# Altium project ORing Board V1.PrjPcb
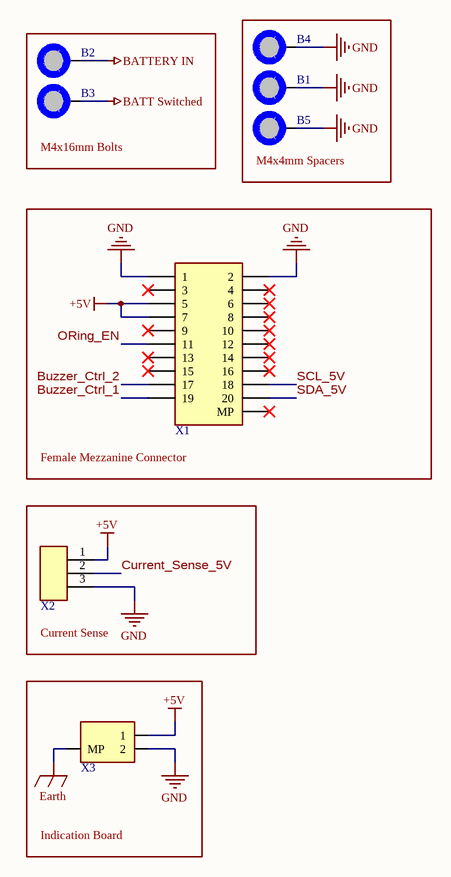
[diagram p0: Connectors.SchDoc]
5 sheets, 70 parts. Net scope: global (net labels, ports and power ports of the same name join across sheets).
Board file: Layout.PcbDoc
Sheets:
  Connectors.SchDoc
  ORing Controller.SchDoc
  Power.SchDoc
  Buzzers.SchDoc
  Current Sensor ADC.SchDoc

## Sheet Connectors.SchDoc
size A; SheetNumber: 1; SheetTotal: 5

### Parts
B1  M4 4mm Spacer  [[Bolt] M4 len=4mm OD=6mm Spacer]  (value not drawn)
B2  M4 16mm  [[Bolt] M4 16mm Button Head Hex Bolt]  (value not drawn)
B3  M4 16mm  [[Bolt] M4 16mm Button Head Hex Bolt]  (value not drawn)
B4  M4 4mm Spacer  [[Bolt] M4 len=4mm OD=6mm Spacer]  (value not drawn)
B5  M4 4mm Spacer  [[Bolt] M4 len=4mm OD=6mm Spacer]  (value not drawn)
X1  [Mezzanine] 20pin 0.4mm Female  [[Mezzanine] 20pin 0.4mm Female]  (value not drawn)
X2  [Sherlock] 3pin 90deg  [[Sherlock] 3pin 90deg]  (value not drawn)
X3  [Pheonix] 2pin 2.5mm pitch  [[Pheonix] 2pin 2.5mm pitch]  (value not drawn)

### Blocks framed on the sheet
M4x16mm Bolts: B2 B3
M4x4mm Spacers: B1 B4 B5
Female Mezzanine Connector: X1
Current Sense: X2
Indication Board: X3

### Nets
+5V: X1.5 X1.7 X2.1 X3.1
BATT Switched: B3.1
BATTERY IN: B2.1
Earth: X3.MP
GND: B1.1 B4.1 B5.1 X1.1 X1.2 X2.3 X3.2
Buzzer_Ctrl_1: X1.19
Buzzer_Ctrl_2: X1.17
Current_Sense_5V: X2.2
ORing_EN: X1.11
SCL_5V: X1.18
SDA_5V: X1.20

Not connected (* = marked no-connect by the designer): X1 3* 4* 6* 8* 9* 10* 12* 13* 14* 15* 16* MP*

### Library data of the parts
B1 B4 B5 = [Bolt] M4 len=4mm OD=6mm Spacer: ID: 4mm / OD: 6mm; System: Connector; ComponentLink1Description: McMaster Supplier; ComponentLink1URL: https://www.mcmaster.com/94669A006/
B2 B3 = [Bolt] M4 16mm Button Head Hex Bolt: 92095A194; System: Connector; ComponentLink1Description: McMaster Link; ComponentLink1URL: https://www.mcmaster.com/92095A194/
X1 = [Mezzanine] 20pin 0.4mm Female: DF40C-20DP-0.4V(51); System: Connector; Supplier 1: DigiKey; Supplier Part Number 1: H11618CT-ND
X2 = [Sherlock] 3pin 90deg: 0353630360; Supplier 1: DigiKey; Supplier Part Number 1: WM18932-ND
X3 = [Pheonix] 2pin 2.5mm pitch: 1778764; System: Connector; Supplier 1: DigiKey; Supplier Part Number 1: 277-2315-1-ND

## Sheet ORing Controller.SchDoc
size B; SheetNumber: 2; SheetTotal: 5
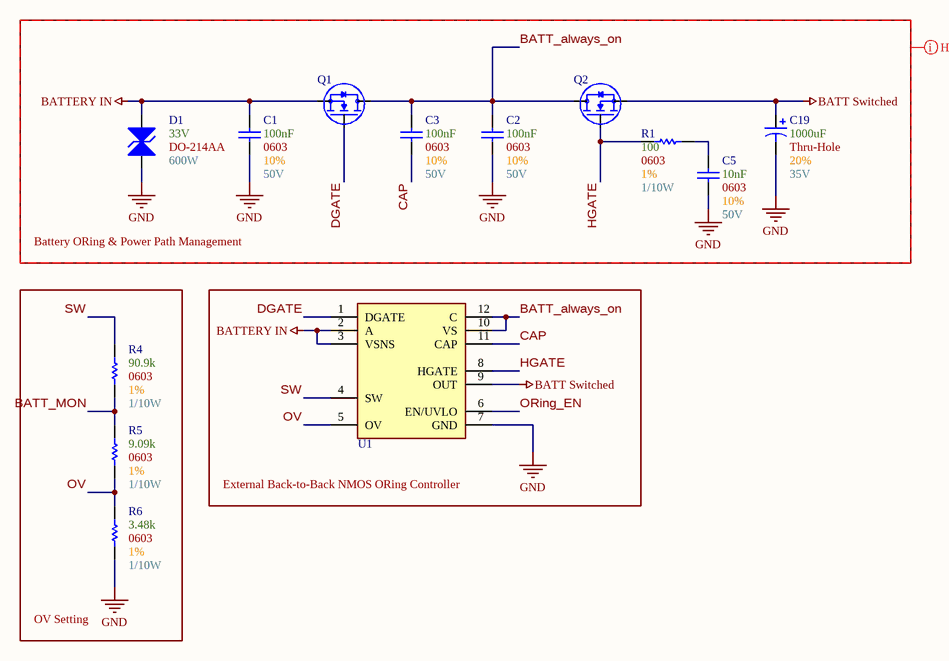
[diagram p1: ORing Controller.SchDoc]

### Parts
C1  Max Voltage: 50V  Size Package: 0603  Tolerance: 10%  Capacitance: 100nF  [[Cap] SMD 0603]  (hidden comment: [Cap] 0603 0.1uF 10% 50V)
C2  Max Voltage: 50V  Size Package: 0603  Tolerance: 10%  Capacitance: 100nF  [[Cap] SMD 0603]  (hidden comment: [Cap] 0603 0.1uF 10% 50V)
C3  Max Voltage: 50V  Size Package: 0603  Tolerance: 10%  Capacitance: 100nF  [[Cap] SMD 0603]  (hidden comment: [Cap] 0603 0.1uF 10% 50V)
C5  Max Voltage: 50V  Size Package: 0603  Tolerance: 10%  Capacitance: 10nF  [[Cap] SMD 0603]  (hidden comment: [Cap] 0603 0.01uF 10% 50V)
C19  Max Voltage: 35V  Size Package: Thru-Hole  Tolerance: 20%  Capacitance: 1000uF  [[Cap] Thru-Hole Right-Angle Polarized 10mm]  (hidden comment: [Cap] Thru-Hole 1000uF 20% 35V)
D1  Wattage: 600W  Optimal Zener Voltage: 33V  [[Diode] SMD DO-214AA]  (hidden comment: DO-214AA)
Q1  [NMOS] SMD 40V 175A 0.55mOhm  [[NMOS] SMD 40V 175A 0.55mOhm]  (value not drawn)
Q2  [NMOS] SMD 40V 175A 0.55mOhm  [[NMOS] SMD 40V 175A 0.55mOhm]  (value not drawn)
R1  Wattage: 1/10W  Tolerance: 1%  Resistance: 100  Size Package: 0603  [[Res] SMD 0603]  (hidden comment: [100] SMD 0603 1% 1/10W)
R4  Wattage: 1/10W  Tolerance: 1%  Resistance: 90.9k  Size Package: 0603  [[Res] SMD 0603]  (hidden comment: [90.9k] SMD 0603 1% 1/10W)
R5  Wattage: 1/10W  Tolerance: 1%  Resistance: 9.09k  Size Package: 0603  [[Res] SMD 0603]  (hidden comment: [9.09k] SMD 0603 1% 1/10W)
R6  Wattage: 1/10W  Tolerance: 1%  Resistance: 3.48k  Size Package: 0603  [[Res] SMD 0603]  (hidden comment: [3.48k] SMD 0603 1% 1/10W_1)
U1  [ORing] Back-to-Back External NMOS Controller  [[ORing] Back-to-Back External NMOS Controller]  (value not drawn)

### Blocks framed on the sheet
Battery ORing & Power Path Management: C1-C3 C5 C19 D1 Q1 Q2 R1
OV Setting: R4-R6
External Back-to-Back NMOS ORing Controller: U1

### Nets
BATT Switched: C19.1 Q2.1(Source) U1.9(OUT)
BATTERY IN: C1.2 D1.2(K) Q1.1(Source) U1.2(A) U1.3(VSNS)
GND: C1.1 C2.1 C5.1 C19.2 D1.1(A) R6.2 U1.7(GND)
BATT_always_on: C2.2 C3.2 Q1.3(Drain) Q2.3(Drain) U1.10(VS) U1.12(C)
BATT_MON: R4.1 R5.2
CAP: C3.1 U1.11(CAP)
DGATE: Q1.2(Gate) U1.1(DGATE)
HGATE: Q2.2(Gate) R1.1 U1.8(HGATE)
ORing_EN: U1.6(EN/UVLO)
OV: R5.1 R6.1 U1.5(OV)
SW: R4.2 U1.4(SW)
NetC5_2: C5.2 R1.2

### Layout directives
net class High_Current_Nets: BATT Switched, BATT_always_on, BATTERY IN, CAP, DGATE, GND, HGATE

### Library data of the parts
C1-C3 = [Cap] 0603 0.1uF 10% 50V: CL10B104KB8NNNC; Supplier 1: DigiKey; Supplier Part Number 1: 1276-1000-6-ND
C5 = [Cap] 0603 0.01uF 10% 50V: C0603C103K5RACTU; Supplier 1: DigiKey; Supplier Part Number 1: 399-C0603C103K5RACTUDKR-ND
C19 = [Cap] Thru-Hole 1000uF 20% 35V: 35PK1000MEFC10X20; Supplier 1: DigiKey; Supplier Part Number 1: 1189-1742-ND
D1 = [TVS] SMBJ33CA: SMBJ33CA; Supplier 1: DigiKey; Supplier Part Number 1: SMBJ33CA-FDICT-ND; Footprint: DO-214AA
Q1 Q2 = [NMOS] SMD 40V 175A 0.55mOhm: IAUCN04S7N005ATMA1; Supplier 1: DigiKey; Supplier Part Number 1: 448-IAUCN04S7N005ATMA1CT-ND
R1 = [100] SMD 0603 1% 1/10W: RC0603FR-07100RL; Supplier 1: DigiKey; Supplier Part Number 1: 311-100HRDKR-ND
R4 = [90.9k] SMD 0603 1% 1/10W: CR0603-FX-9092ELF; Supplier 1: DigiKey; Supplier Part Number 1: CR0603-FX-9092ELFCT-ND
R5 = [9.09k] SMD 0603 1% 1/10W: RMCF0603FT9K09; Supplier 1: DigiKey; Supplier Part Number 1: RMCF0603FT9K09CT-ND
R6 = [3.48k] SMD 0603 1% 1/10W_1: RMCF0603FT3K48; Supplier 1: DigiKey; Supplier Part Number 1: RMCF0603FT3K48CT-ND
U1 = [ORing] Back-to-Back External NMOS Controller: LM74810QDRRRQ1; Supplier 1: DigiKey; Supplier Part Number 1: 296-LM74810QDRRRQ1CT-ND

## Sheet Power.SchDoc
size B; SheetNumber: 3; SheetTotal: 5
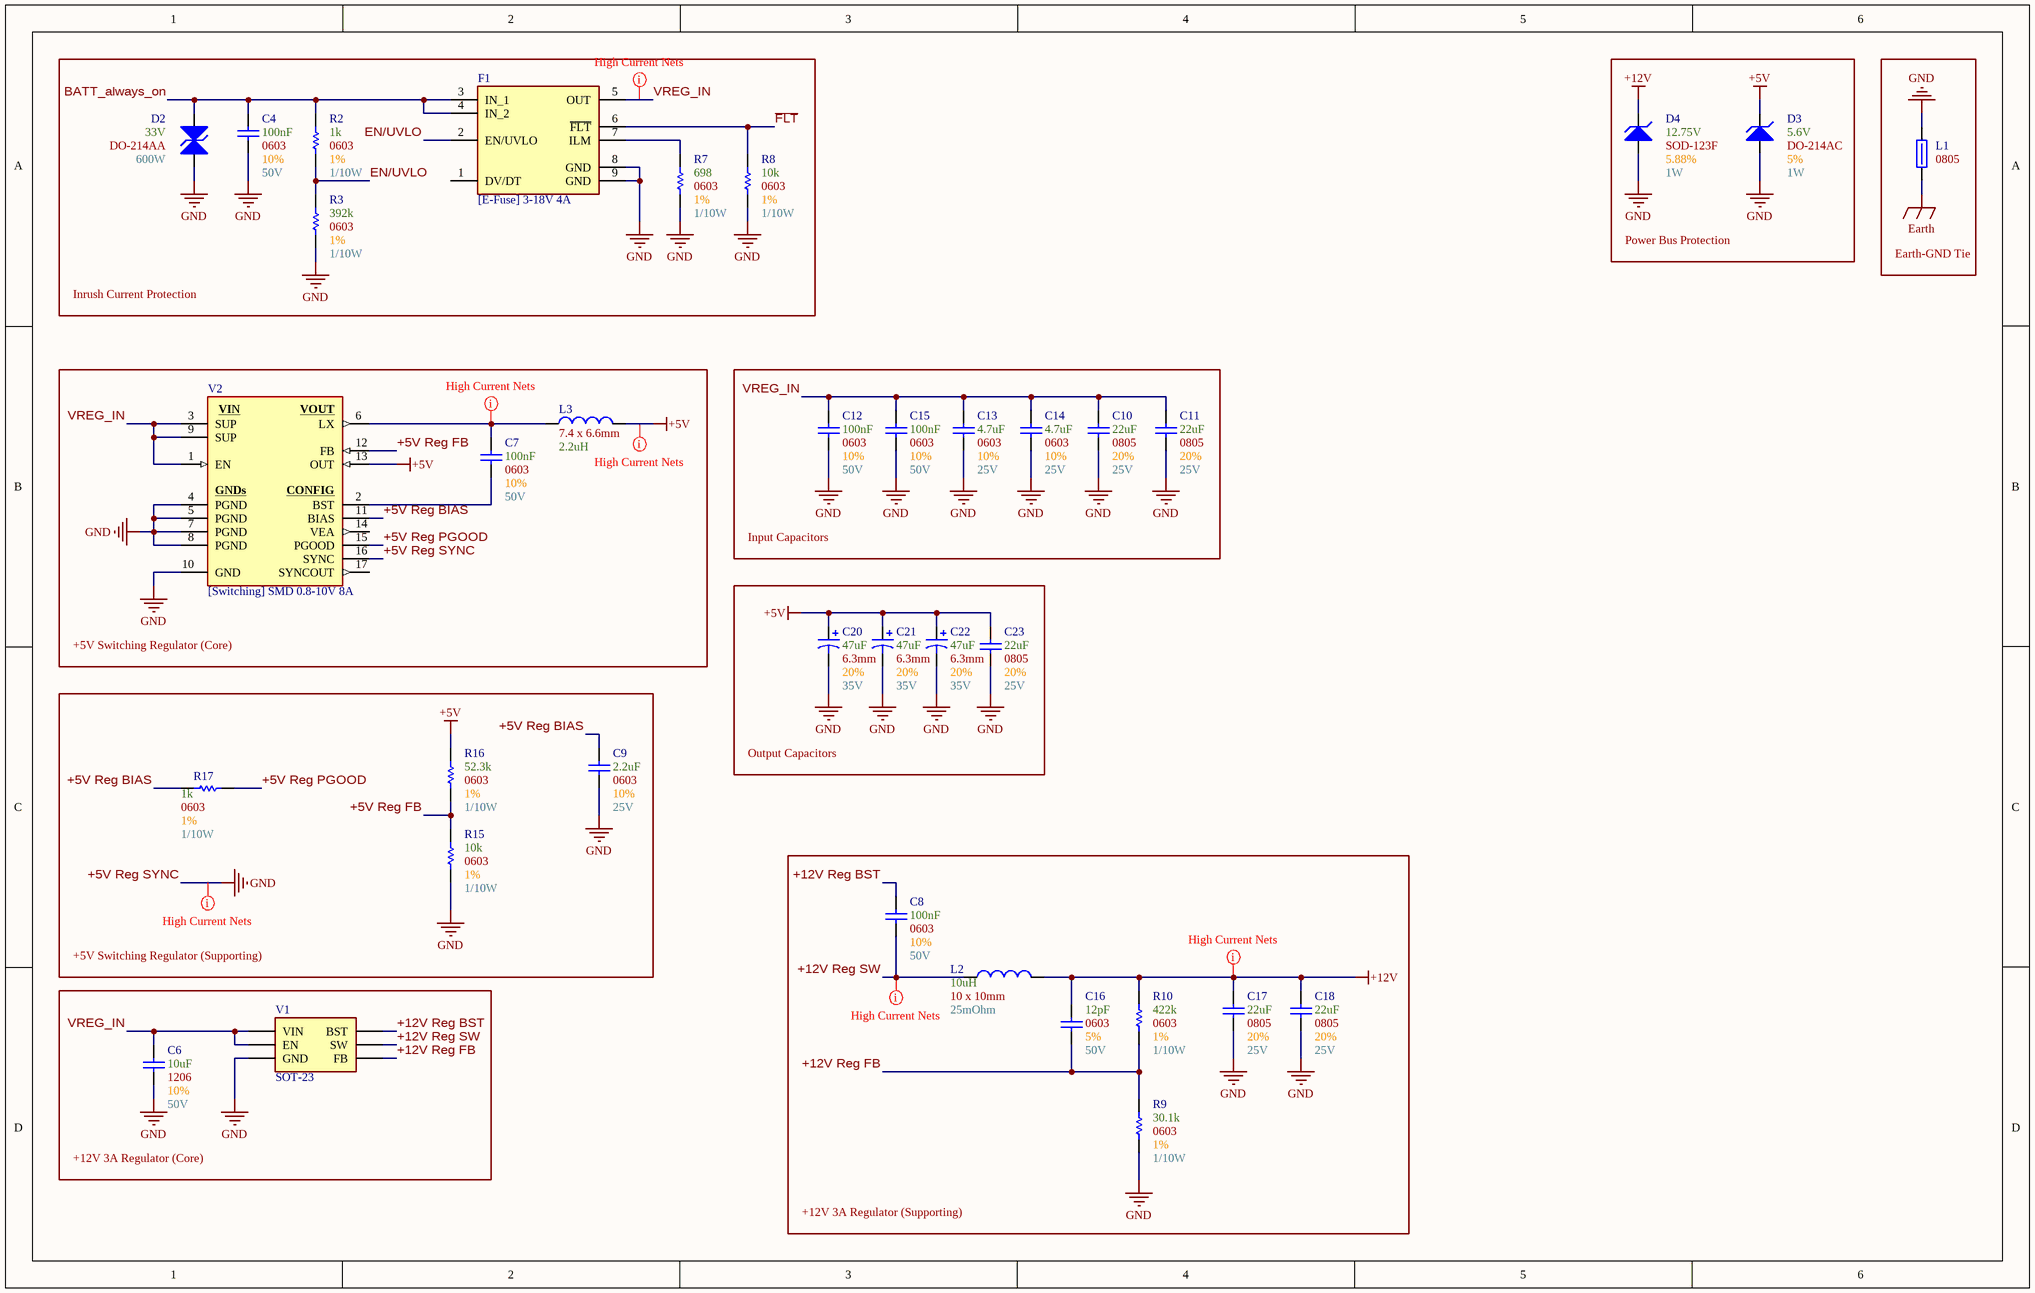
[diagram p2: Power.SchDoc]

### Parts
C4  Max Voltage: 50V  Size Package: 0603  Tolerance: 10%  Capacitance: 100nF  [[Cap] SMD 0603]  (hidden comment: [Cap] 0603 0.1uF 10% 50V)
C6  Max Voltage: 50V  Size Package: 1206  Tolerance: 10%  Capacitance: 10uF  [[Cap] SMD 1206]  (hidden comment: [Cap] 1206 10uF 20% 50V)
C7  Max Voltage: 50V  Size Package: 0603  Tolerance: 10%  Capacitance: 100nF  [[Cap] SMD 0603]  (hidden comment: [Cap] 0603 0.1uF 10% 50V)
C8  Max Voltage: 50V  Size Package: 0603  Tolerance: 10%  Capacitance: 100nF  [[Cap] SMD 0603]  (hidden comment: [Cap] 0603 0.1uF 10% 50V)
C9  Max Voltage: 25V  Size Package: 0603  Tolerance: 10%  Capacitance: 2.2uF  [[Cap] SMD 0603]  (hidden comment: [Cap] 0603 2.2uF 10% 25V)
C10  Max Voltage: 25V  Size Package: 0805  Tolerance: 20%  Capacitance: 22uF  [[Cap] SMD 0805]  (hidden comment: [Cap] 0805 22uF 20% 25V)
C11  Max Voltage: 25V  Size Package: 0805  Tolerance: 20%  Capacitance: 22uF  [[Cap] SMD 0805]  (hidden comment: [Cap] 0805 22uF 20% 25V)
C12  Max Voltage: 50V  Size Package: 0603  Tolerance: 10%  Capacitance: 100nF  [[Cap] SMD 0603]  (hidden comment: [Cap] 0603 0.1uF 10% 50V)
C13  Max Voltage: 25V  Size Package: 0603  Tolerance: 10%  Capacitance: 4.7uF  [[Cap] SMD 0603]  (hidden comment: [Cap] 0603 4.7uF 10% 25V)
C14  Max Voltage: 25V  Size Package: 0603  Tolerance: 10%  Capacitance: 4.7uF  [[Cap] SMD 0603]  (hidden comment: [Cap] 0603 4.7uF 10% 25V)
C15  Max Voltage: 50V  Size Package: 0603  Tolerance: 10%  Capacitance: 100nF  [[Cap] SMD 0603]  (hidden comment: [Cap] 0603 0.1uF 10% 50V)
C16  Max Voltage: 50V  Size Package: 0603  Tolerance: 5%  Capacitance: 12pF  [[Cap] SMD 0603]  (hidden comment: [Cap] 0603 12pF 5% 50V)
C17  Max Voltage: 25V  Size Package: 0805  Tolerance: 20%  Capacitance: 22uF  [[Cap] SMD 0805]  (hidden comment: [Cap] 0805 22uF 20% 25V)
C18  Max Voltage: 25V  Size Package: 0805  Tolerance: 20%  Capacitance: 22uF  [[Cap] SMD 0805]  (hidden comment: [Cap] 0805 22uF 20% 25V)
C20  Max Voltage: 35V  Size Package: 6.3mm  Tolerance: 20%  Capacitance: 47uF  [[Cap] SMD Polarized, 6.3mm]  (hidden comment: [Cap] 6.3mm 47uF 20% 35V)
C21  Max Voltage: 35V  Size Package: 6.3mm  Tolerance: 20%  Capacitance: 47uF  [[Cap] SMD Polarized, 6.3mm]  (hidden comment: [Cap] 6.3mm 47uF 20% 35V)
C22  Max Voltage: 35V  Size Package: 6.3mm  Tolerance: 20%  Capacitance: 47uF  [[Cap] SMD Polarized, 6.3mm]  (hidden comment: [Cap] 6.3mm 47uF 20% 35V)
C23  Max Voltage: 25V  Size Package: 0805  Tolerance: 20%  Capacitance: 22uF  [[Cap] SMD 0805]  (hidden comment: [Cap] 0805 22uF 20% 25V)
D2  Wattage: 600W  Optimal Zener Voltage: 33V  [[Diode] SMD DO-214AA]  (hidden comment: DO-214AA)
D3  Tolerance: 5%  Wattage: 1W  Optimal Zener Voltage: 5.6V  [[Diode] SMD DO-214AC]  (hidden comment: DO-214AC)
D4  Tolerance: 5.88%  Wattage: 1W  Optimal Zener Voltage: 12.75V  [[Diode] SOD-123F]  (hidden comment: SOD-123F)
F1  [E-Fuse] 3-18V 4A  [[E-Fuse] 3-18V 4A]
L1  Size Package: 0805  [[Ferrite] SMD 0805]  (hidden comment: 652-MH2029-300Y)
L2  DC Resistance: 25mOhm  Package: 10 x 10mm  Inductance: 10uH  [[10uH] SMD Nonstandard 3.8A]  (hidden comment: [10uH] SMD Nonstandard 3.8A)
L3  Package: 7.4 x 6.6mm  Inductance: 2.2uH  [[Inductor] SMD 7.4 X 6.6 X 3 MM]  (hidden comment: [2.2uH] SMD Nonstandard 10A)
R2  Wattage: 1/10W  Tolerance: 1%  Resistance: 1k  Size Package: 0603  [[Res] SMD 0603]  (hidden comment: [1k] SMD 0603 1% 1/10W)
R3  Wattage: 1/10W  Tolerance: 1%  Resistance: 392k  Size Package: 0603  [[Res] SMD 0603]  (hidden comment: [392k] SMD 0603 1% 1/10W)
R7  Wattage: 1/10W  Tolerance: 1%  Resistance: 698  Size Package: 0603  [[Res] SMD 0603]  (hidden comment: [698] SMD 0603 1% 1/10W_1)
R8  Wattage: 1/10W  Tolerance: 1%  Resistance: 10k  Size Package: 0603  [[Res] SMD 0603]  (hidden comment: [10k] SMD 0603 1% 1/8W)
R9  Wattage: 1/10W  Tolerance: 1%  Resistance: 30.1k  Size Package: 0603  [[Res] SMD 0603]  (hidden comment: [30.1k] SMD 0603 1% 1/10W)
R10  Wattage: 1/10W  Tolerance: 1%  Resistance: 422k  Size Package: 0603  [[Res] SMD 0603]  (hidden comment: [422k] SMD 0603 1% 1/10W)
R15  Wattage: 1/10W  Tolerance: 1%  Resistance: 10k  Size Package: 0603  [[Res] SMD 0603]  (hidden comment: [10k] SMD 0603 1% 1/8W)
R16  Wattage: 1/10W  Tolerance: 1%  Resistance: 52.3k  Size Package: 0603  [[Res] SMD 0603]  (hidden comment: [52.3k] SMD 0603 1% 1/10W)
R17  Wattage: 1/10W  Tolerance: 1%  Resistance: 1k  Size Package: 0603  [[Res] SMD 0603]  (hidden comment: [1k] SMD 0603 1% 1/10W)
V1  SOT-23  [SOT-23]
V2  [Switching] SMD 0.8-10V 8A  [[Switching] 17-PowerWFQFN]

### Blocks framed on the sheet
Inrush Current Protection: C4 D2 F1 R2 R3 R7 R8
Power Bus Protection: D3 D4
Earth-GND Tie: L1
+5V Switching Regulator (Core): C7 L3 V2
Input Capacitors: C10-C15
Output Capacitors: C20-C23
+5V Switching Regulator (Supporting): C9 R15-R17
+12V 3A Regulator (Supporting): C8 C16-C18 L2 R9 R10
+12V 3A Regulator (Core): C6 V1

### Nets
+5V: C20.1 C21.1 C22.1 C23.2 D3.1(K) L3.2 R16.2 V2.13(OUT)
+12V: C16.2 C17.2 C18.2 D4.1(K) L2.2 R10.2
Earth: L1.1
GND: C4.1 C6.1 C9.1 C10.1 C11.1 C12.1 C13.1 C14.1 C15.1 C17.1 C18.1 C20.2 C21.2 C22.2 C23.1 D2.1(A) D3.2(A) D4.2(A) F1.8(GND) F1.9(GND) L1.2 R3.1 R7.1 R8.1 R9.1 R15.1 V1.4(GND) V2.4(PGND) V2.5(PGND) V2.7(PGND) V2.8(PGND) V2.10(GND) V2.16(SYNC)  [also labelled +5V Reg SYNC]
+5V Reg BIAS: C9.2 R17.1 V2.11(BIAS)
+5V Reg FB: R15.2 R16.1 V2.12(FB)
+5V Reg PGOOD: R17.2 V2.15(PGOOD)
+12V Reg BST: C8.2 V1.6(BST)
+12V Reg FB: C16.1 R9.2 R10.1 V1.1(FB)
+12V Reg SW: C8.1 L2.1 V1.5(SW)
~{FLT}: F1.6(~{FLT}) R8.2
BATT_always_on: C4.2 D2.2(K) F1.3(IN_1) F1.4(IN_2) R2.2
EN/UVLO: F1.2(EN/UVLO) R2.1 R3.2
VREG_IN: C6.2 C10.2 C11.2 C12.2 C13.2 C14.2 C15.2 F1.5(OUT) V1.2(EN) V1.3(VIN) V2.1(EN) V2.3(SUP) V2.9(SUP)
NetC7_1: C7.1 V2.2(BST)
NetC7_2: C7.2 L3.1 V2.6(LX)
NetF1_7: F1.7(ILM) R7.2

Not connected (* = marked no-connect by the designer): F1 1(DV/DT); V2 14(VEA) 17(SYNCOUT)

### Layout directives
net class High_Current_Nets: +5V, +12V, +12V Reg SW, GND, NetC7_2, VREG_IN

### Notes on the sheet
- (in symbol [Switching] SMD 0.8-10V 8A) VIN; VOUT; GNDs; CONFIG

### Library data of the parts
C4 C7 C8 C12 C15 = [Cap] 0603 0.1uF 10% 50V: CL10B104KB8NNNC; Supplier 1: DigiKey; Supplier Part Number 1: 1276-1000-6-ND
C6 = [Cap] 1206 10uF 20% 50V: CGA5L3X5R1H106M160AB; Supplier 1: DigiKey; Supplier Part Number 1: 445-12883-6-ND
C9 = [Cap] 0603 2.2uF 10% 25V: GRM188R61E225KA12D; Supplier 1: DigiKey; Supplier Part Number 1: 490-10731-1-ND
C10 C11 C17 C18 C23 = [Cap] 0805 22uF 20% 25V: CL21A226MAYNNWE; Supplier 1: DigiKey; Supplier Part Number 1: 1276-CL21A226MAYNNWECT-ND
C13 C14 = [Cap] 0603 4.7uF 10% 25V: GRM188R61E475KE11D; Supplier 1: DigiKey; Supplier Part Number 1: 490-7203-6-ND
C16 = [Cap] 0603 12pF 5% 50V: C0603C120J5GACTU; Supplier 1: DigiKey; Supplier Part Number 1: 399-C0603C120J5GACTUCT-ND
C20-C22 = [Cap] 6.3mm 47uF 20% 35V: UWT1V470MCL1GS; Supplier 1: DigiKey; Supplier Part Number 1: 493-2202-1-ND
D2 = [TVS] SMBJ33CA: SMBJ33CA; Supplier 1: DigiKey; Supplier Part Number 1: SMBJ33CA-FDICT-ND; Footprint: DO-214AA
D3 = [Zener] SMD 5.6V 1W 5%: SMAZ5V6-13-F; Supplier 1: DigiKey; Supplier Part Number 1: SMAZ5V6-FDICT-ND; Footprint: DO-214AC
D4 = [Zener] SMD 12.75V 1W 5.88%: KDZVTR12B; Supplier 1: DigiKey; Supplier Part Number 1: KDZVTR12BCT-ND; Footprint: SOD-123F
F1 = [E-Fuse] 3-18V 4A: TPS259571DSGR; Supplier 1: DigiKey; Supplier Part Number 1: 296-50500-1-ND
L1 = [Ferrite] SMD 0805 3A 30ohm: Res @ Freq: 30 @ 100MHz; Supplier 1: DigiKey; Supplier Part Number 1: MH2029-300YCT-ND
L2 = [10uH] SMD Nonstandard 3.8A: SRU1038-100Y; Supplier 1: DigiKey; Supplier Part Number 1: SRU1038-100YCT-ND
L3 = [2.2uH] SMD Nonstandard 10A: ECS-MPIL0630-2R2MC; Supplier 1: DigiKey; Supplier Part Number 1: XC2402CT-ND
R2 R17 = [1k] SMD 0603 1% 1/10W: RMCF0603FT1K00; Supplier 1: DigiKey; Supplier Part Number 1: RMCF0603FT1K00DKR-ND
R3 = [392k] SMD 0603 1% 1/10W: CR0603-FX-3923ELF; Supplier 1: DigiKey; Supplier Part Number 1: 118-CR0603-FX-3923ELFCT-ND
R7 = [698] SMD 0603 1% 1/10W_1: RMCF0603FT698R; Supplier 1: DigiKey; Supplier Part Number 1: RMCF0603FT698RCT-ND
R8 R15 = [10k] SMD 0603 1% 1/8W: RMCF0603FT10K0; Supplier 1: DigiKey; Supplier Part Number 1: RMCF0603FT10K0DKR-ND
R9 = [30.1k] SMD 0603 1% 1/10W: RC0603FR-0730K1L; Supplier 1: DigiKey; Supplier Part Number 1: 311-30.1KHRCT-ND
R10 = [422k] SMD 0603 1% 1/10W: ERJ-3EKF4223V; Supplier 1: DigiKey; Supplier Part Number 1: P422KHDKR-ND
R16 = [52.3k] SMD 0603 1% 1/10W: RC0603FR-0752K3L; Supplier 1: DigiKey; Supplier Part Number 1: 311-52.3KHRCT-ND
V1 = [Switching] SMD 0.8-31V 3A: AP63301WU-7; Supplier 1: DigiKey; Supplier Part Number 1: 31-AP63301WU-7CT-ND
V2 = [Switching] SMD 0.8-10V 8A: MAX20408AFOF/VY+; Supplier 1: DigiKey; Supplier Part Number 1: 505-MAX20408AFOF/VY+-ND

## Sheet Buzzers.SchDoc
size A; SheetNumber: 4; SheetTotal: 5
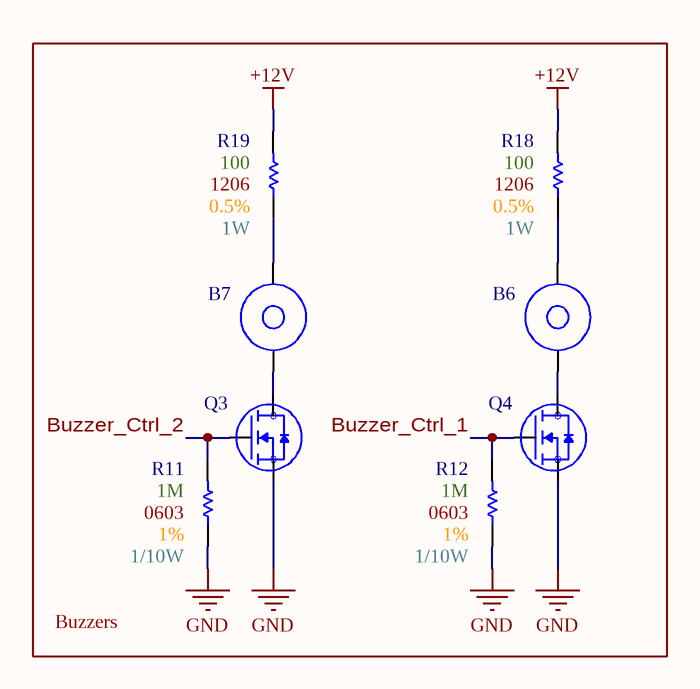
[diagram p3: Buzzers.SchDoc]

### Parts
B6  Passive buzzer  [[Buzzer] Passive SMD 12V 80mA]  (value not drawn)
B7  Passive buzzer  [[Buzzer] Passive SMD 12V 80mA]  (value not drawn)
Q3  [NMOS] SMD 20V 1.4A 160mOhm  [SOT323]  (value not drawn)
Q4  [NMOS] SMD 20V 1.4A 160mOhm  [SOT323]  (value not drawn)
R11  Wattage: 1/10W  Tolerance: 1%  Resistance: 1M  Size Package: 0603  [[Res] SMD 0603]  (hidden comment: [1M] SMD 0603 1% 1/10W)
R12  Wattage: 1/10W  Tolerance: 1%  Resistance: 1M  Size Package: 0603  [[Res] SMD 0603]  (hidden comment: [1M] SMD 0603 1% 1/10W)
R18  Wattage: 1W  Tolerance: 0.5%  Resistance: 100  Size Package: 1206  [[Res] SMD 1206]  (hidden comment: [100] SMD 1206 0.5% 1W)
R19  Wattage: 1W  Tolerance: 0.5%  Resistance: 100  Size Package: 1206  [[Res] SMD 1206]  (hidden comment: [100] SMD 1206 0.5% 1W)

### Blocks framed on the sheet
Buzzers: B6 B7 Q3 Q4 R11 R12 R18 R19

### Nets
+12V: R18.2 R19.2
GND: Q3.2(Source) Q4.2(Source) R11.1 R12.1
Buzzer_Ctrl_1: Q4.1(Gate) R12.2
Buzzer_Ctrl_2: Q3.1(Gate) R11.2
NetB6_1: B6.1(+) R18.1
NetB6_2: B6.2(-) Q4.3(Drain)
NetB7_1: B7.1(+) R19.1
NetB7_2: B7.2(-) Q3.3(Drain)

### Library data of the parts
B6 B7 = [Buzzer] Passive SMD 12V 80mA: CT08E-16S400-2; Supplier 1: DigiKey; Supplier Part Number 1: 2603-CT08E-16S400-2CT-ND
Q3 Q4 = [NMOS] SMD 20V 1.4A 160mOhm: BSS816NWH6327XTSA1; Supplier 1: DigiKey; Supplier Part Number 1: BSS816NWH6327XTSA1CT-ND
R11 R12 = [1M] SMD 0603 1% 1/10W: RC0603FR-071ML; Supplier 1: DigiKey; Supplier Part Number 1: 311-1.00MHRDKR-ND
R18 R19 = [100] SMD 1206 0.5% 1W: HRG3216P-1000-D-T1; Supplier 1: DigiKey; Supplier Part Number 1: 408-1865-1-ND

## Sheet Current Sensor ADC.SchDoc
size A; SheetNumber: 5; SheetTotal: 5
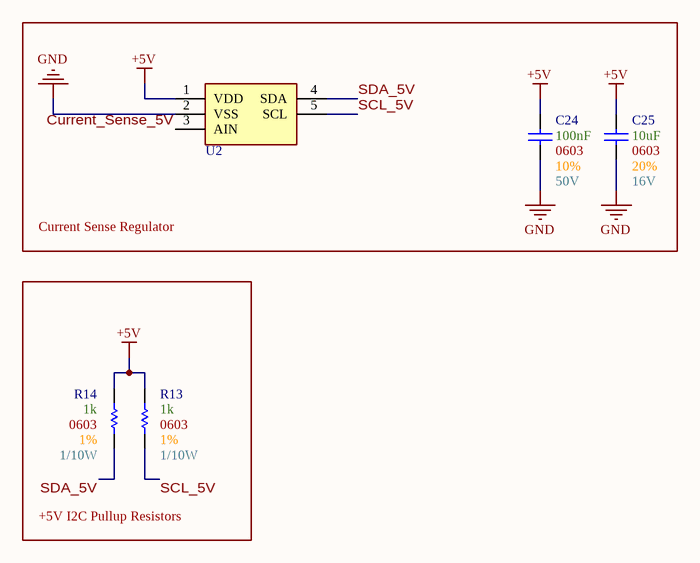
[diagram p4: Current Sensor ADC.SchDoc]

### Parts
C24  Max Voltage: 50V  Size Package: 0603  Tolerance: 10%  Capacitance: 100nF  [[Cap] SMD 0603]  (hidden comment: [Cap] 0603 0.1uF 10% 50V)
C25  Max Voltage: 16V  Size Package: 0603  Tolerance: 20%  Capacitance: 10uF  [[Cap] SMD 0603]  (hidden comment: [Cap] 0603 10uF 20% 16V)
R13  Wattage: 1/10W  Tolerance: 1%  Resistance: 1k  Size Package: 0603  [[Res] SMD 0603]  (hidden comment: [1k] SMD 0603 1% 1/10W)
R14  Wattage: 1/10W  Tolerance: 1%  Resistance: 1k  Size Package: 0603  [[Res] SMD 0603]  (hidden comment: [1k] SMD 0603 1% 1/10W)
U2  [ADC] 2.7-5.5V 12bit Single-Ended  [[ADC] 2.7-5.5V 12bit Single-Ended]  (value not drawn)

### Blocks framed on the sheet
Current Sense Regulator: C24 C25 U2
+5V I2C Pullup Resistors: R13 R14

### Nets
+5V: C24.2 C25.2 R13.2 R14.2 U2.1(VDD)
GND: C24.1 C25.1 U2.2(VSS)
Current_Sense_5V: U2.3(AIN)
SCL_5V: R13.1 U2.5(SCL)
SDA_5V: R14.1 U2.4(SDA)

### Library data of the parts
C24 = [Cap] 0603 0.1uF 10% 50V: CL10B104KB8NNNC; Supplier 1: DigiKey; Supplier Part Number 1: 1276-1000-6-ND
C25 = [Cap] 0603 10uF 20% 16V: GRM188C81C106MA73D; Supplier 1: DigiKey; Supplier Part Number 1: 490-7198-1-ND
R13 R14 = [1k] SMD 0603 1% 1/10W: RMCF0603FT1K00; Supplier 1: DigiKey; Supplier Part Number 1: RMCF0603FT1K00DKR-ND
U2 = [ADC] 2.7-5.5V 12bit Single-Ended: MCP3221A0T-E/OT; Supplier 1: DigiKey; Supplier Part Number 1: MCP3221A0T-E/OTCT-ND

## Nets that join several sheets
+5V: Connectors (X1.5 X1.7 X2.1 X3.1), Power (8 pins), Current Sensor ADC (5 pins)
+12V: Power (6 pins), Buzzers (R18.2 R19.2)
BATT Switched: Connectors (B3.1), ORing Controller (C19.1 Q2.1 U1.9)
BATTERY IN: Connectors (B2.1), ORing Controller (5 pins)
Earth: Connectors (X3.MP), Power (L1.1)
GND: Connectors (7 pins), ORing Controller (7 pins), Power (33 pins), Buzzers (Q3.2 Q4.2 R11.1 R12.1), Current Sensor ADC (C24.1 C25.1 U2.2)
BATT_always_on: ORing Controller (6 pins), Power (5 pins)
Buzzer_Ctrl_1: Connectors (X1.19), Buzzers (Q4.1 R12.2)
Buzzer_Ctrl_2: Connectors (X1.17), Buzzers (Q3.1 R11.2)
Current_Sense_5V: Connectors (X2.2), Current Sensor ADC (U2.3)
ORing_EN: Connectors (X1.11), ORing Controller (U1.6)
SCL_5V: Connectors (X1.18), Current Sensor ADC (R13.1 U2.5)
SDA_5V: Connectors (X1.20), Current Sensor ADC (R14.1 U2.4)